# Altium schematic sheet Top_Sheet.SchDoc
size 420 x 297 mm; SheetNumber: 1; SheetTotal: 8
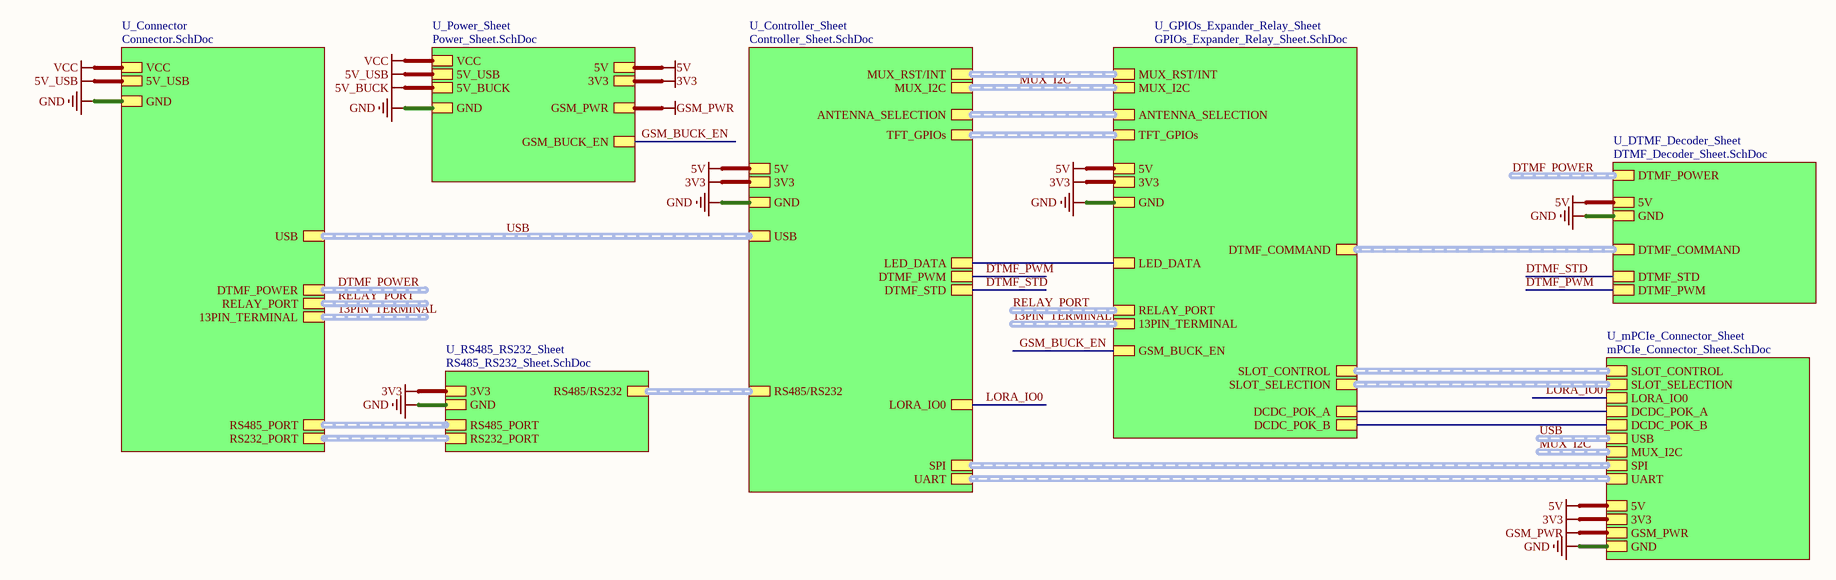
[diagram p0: Top_Sheet.SchDoc]

## Sub-sheets
U_Connector = Connector.SchDoc: VCC, GND, 5V_USB, RS485_PORT (harness RS485_PORT), DTMF_POWER (harness DTMF_POWER), RS232_PORT (harness RS232_PORT), RELAY_PORT (harness RELAY_PORT), 13PIN_TERMINAL (harness 17PIN_TERMINAL), USB (harness USB)
U_Controller_Sheet = Controller_Sheet.SchDoc: UART (harness UART), MUX_RST/INT (harness INTERRUPT), MUX_I2C (harness MUX_I2C), SPI (harness SPI), RS485/RS232 (harness RS485/RS232), USB (harness USB), DTMF_STD, GND, 5V, 3V3, ANTENNA_SELECTION (harness 17PIN_TERMINAL), LED_DATA, LORA_IO0, DTMF_PWM, TFT_GPIOs (harness 17PIN_TERMINAL)
U_DTMF_Decoder_Sheet = DTMF_Decoder_Sheet.SchDoc: DTMF_POWER (harness DTMF_POWER), 5V, GND, DTMF_COMMAND (harness DTMF_COMMAND), DTMF_STD, DTMF_PWM
U_GPIOs_Expander_Relay_Sheet = GPIOs_Expander_Relay_Sheet.SchDoc: 3V3, GND, 5V, DTMF_COMMAND (harness DTMF_COMMAND), RELAY_PORT (harness RELAY_PORT), 13PIN_TERMINAL (harness 17PIN_TERMINAL), SLOT_SELECTION (harness SLOT_SELECTION), MUX_RST/INT (harness INTERRUPT), MUX_I2C (harness MUX_I2C), DCDC_POK_A, SLOT_CONTROL (harness SLOT_CONTROL), ANTENNA_SELECTION (harness 17PIN_TERMINAL), LED_DATA, GSM_BUCK_EN, DCDC_POK_B, TFT_GPIOs (harness 17PIN_TERMINAL)
U_mPCIe_Connector_Sheet = mPCIe_Connector_Sheet.SchDoc: SLOT_SELECTION (harness SLOT_SELECTION), SLOT_CONTROL (harness SLOT_CONTROL), SPI (harness SPI), DCDC_POK_A, USB (harness USB), 5V, 3V3, MUX_I2C (harness MUX_I2C), GSM_PWR, GND, UART (harness UART), LORA_IO0, DCDC_POK_B
U_Power_Sheet = Power_Sheet.SchDoc: VCC, 5V_BUCK, GND, GSM_BUCK_EN, 5V_USB, GSM_PWR, 5V, 3V3
U_RS485_RS232_Sheet = RS485_RS232_Sheet.SchDoc: GND, RS485_PORT (harness RS485_PORT), RS232_PORT (harness RS232_PORT), 3V3, RS485/RS232 (harness RS485/RS232)

## Nets
3V3: sheet U_Power_Sheet/3V3, sheet U_RS485_RS232_Sheet/3V3, sheet U_mPCIe_Connector_Sheet/3V3, sheet U_Controller_Sheet/3V3, sheet U_GPIOs_Expander_Relay_Sheet/3V3
5V: sheet U_Power_Sheet/5V, sheet U_DTMF_Decoder_Sheet/5V, sheet U_mPCIe_Connector_Sheet/5V, sheet U_Controller_Sheet/5V, sheet U_GPIOs_Expander_Relay_Sheet/5V
5V_BUCK: sheet U_Power_Sheet/5V_BUCK
5V_USB: sheet U_Connector/5V_USB, sheet U_Power_Sheet/5V_USB
GND: sheet U_Connector/GND, sheet U_Power_Sheet/GND, sheet U_DTMF_Decoder_Sheet/GND, sheet U_RS485_RS232_Sheet/GND, sheet U_mPCIe_Connector_Sheet/GND, sheet U_Controller_Sheet/GND, sheet U_GPIOs_Expander_Relay_Sheet/GND
GSM_PWR: sheet U_Power_Sheet/GSM_PWR, sheet U_mPCIe_Connector_Sheet/GSM_PWR
VCC: sheet U_Connector/VCC, sheet U_Power_Sheet/VCC
DTMF_PWM: sheet U_DTMF_Decoder_Sheet/DTMF_PWM, sheet U_Controller_Sheet/DTMF_PWM
DTMF_STD: sheet U_DTMF_Decoder_Sheet/DTMF_STD, sheet U_Controller_Sheet/DTMF_STD
GSM_BUCK_EN: sheet U_Power_Sheet/GSM_BUCK_EN, sheet U_GPIOs_Expander_Relay_Sheet/GSM_BUCK_EN
LORA_IO0: sheet U_mPCIe_Connector_Sheet/LORA_IO0, sheet U_Controller_Sheet/LORA_IO0
(unnamed): sheet U_mPCIe_Connector_Sheet/DCDC_POK_A, sheet U_GPIOs_Expander_Relay_Sheet/DCDC_POK_A
(unnamed): sheet U_mPCIe_Connector_Sheet/DCDC_POK_B, sheet U_GPIOs_Expander_Relay_Sheet/DCDC_POK_B
(unnamed): sheet U_Controller_Sheet/LED_DATA, sheet U_GPIOs_Expander_Relay_Sheet/LED_DATA

## Buses and harness runs
harness 13PIN_TERMINAL = sheet U_Connector/13PIN_TERMINAL
harness 13PIN_TERMINAL = sheet U_GPIOs_Expander_Relay_Sheet/13PIN_TERMINAL
harness DTMF_POWER = sheet U_Connector/DTMF_POWER
harness DTMF_POWER = sheet U_DTMF_Decoder_Sheet/DTMF_POWER
harness MUX_I2C = sheet U_Controller_Sheet/MUX_I2C = sheet U_GPIOs_Expander_Relay_Sheet/MUX_I2C
harness MUX_I2C = sheet U_mPCIe_Connector_Sheet/MUX_I2C
harness RELAY_PORT = sheet U_Connector/RELAY_PORT
harness RELAY_PORT = sheet U_GPIOs_Expander_Relay_Sheet/RELAY_PORT
harness sheet U_Connector/RS232_PORT = sheet U_RS485_RS232_Sheet/RS232_PORT
harness sheet U_Connector/RS485_PORT = sheet U_RS485_RS232_Sheet/RS485_PORT
harness sheet U_Controller_Sheet/ANTENNA_SELECTION = sheet U_GPIOs_Expander_Relay_Sheet/ANTENNA_SELECTION
harness sheet U_Controller_Sheet/MUX_RST/INT = sheet U_GPIOs_Expander_Relay_Sheet/MUX_RST/INT
harness sheet U_Controller_Sheet/RS485/RS232 = sheet U_RS485_RS232_Sheet/RS485/RS232
harness sheet U_Controller_Sheet/SPI = sheet U_mPCIe_Connector_Sheet/SPI
harness sheet U_Controller_Sheet/TFT_GPIOs = sheet U_GPIOs_Expander_Relay_Sheet/TFT_GPIOs
harness sheet U_Controller_Sheet/UART = sheet U_mPCIe_Connector_Sheet/UART
harness sheet U_DTMF_Decoder_Sheet/DTMF_COMMAND = sheet U_GPIOs_Expander_Relay_Sheet/DTMF_COMMAND
harness sheet U_GPIOs_Expander_Relay_Sheet/SLOT_CONTROL = sheet U_mPCIe_Connector_Sheet/SLOT_CONTROL
harness sheet U_GPIOs_Expander_Relay_Sheet/SLOT_SELECTION = sheet U_mPCIe_Connector_Sheet/SLOT_SELECTION
harness USB = sheet U_Connector/USB = sheet U_Controller_Sheet/USB
harness USB = sheet U_mPCIe_Connector_Sheet/USB

## Notes on the sheet
- File:
- Title:
- Date:
- Page
- Num:
- Total:
- Drawn By: Huzaifa Ali